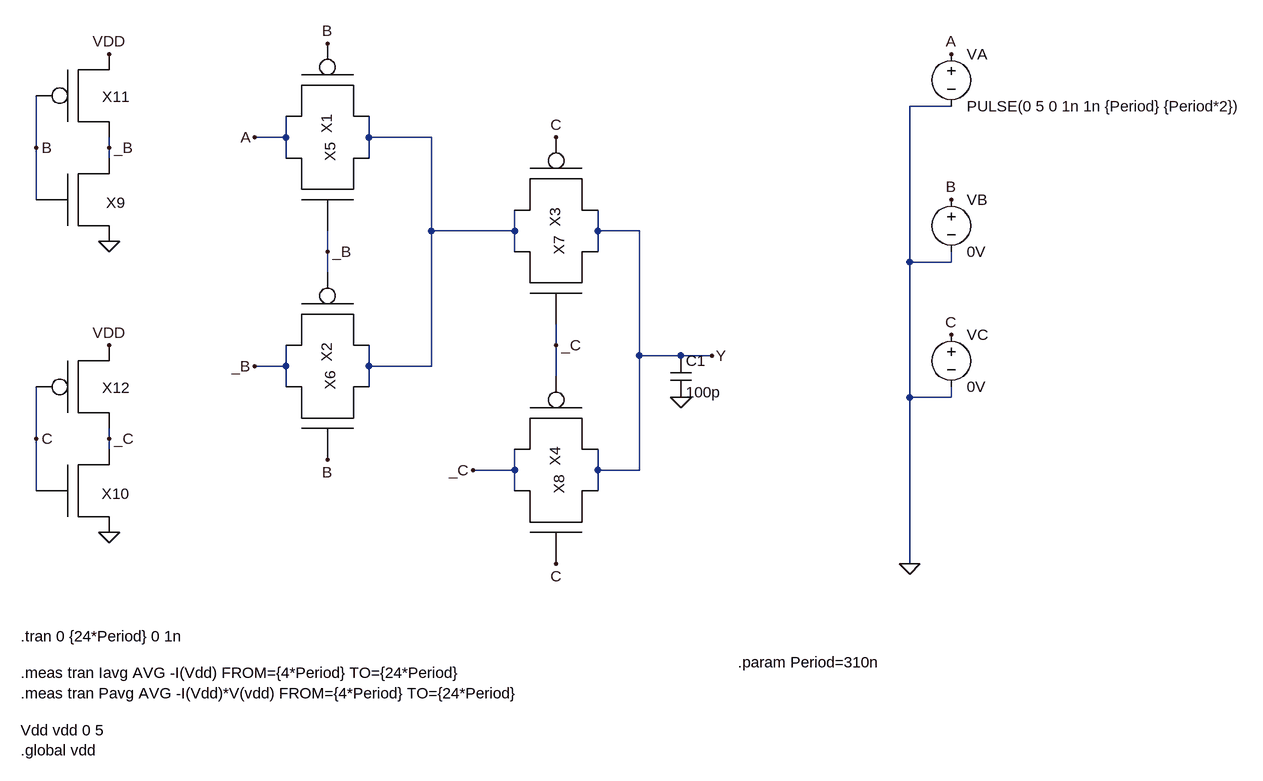
[diagram p0: schematic TLabPonto3_3.asc]
TLabPonto3_3.asc, the LTspice schematic file:
Version 4.1
SHEET 1 1704 848
WIRE 1088 -224 1024 -224
WIRE 64 -176 64 -208
WIRE 64 -176 16 -176
WIRE 192 -176 192 -208
WIRE 288 -176 192 -176
WIRE -320 -160 -320 -240
WIRE -208 -160 -208 -176
WIRE -208 -144 -208 -160
WIRE 64 -144 64 -176
WIRE 192 -144 192 -176
WIRE -320 -80 -320 -160
WIRE 288 -32 288 -176
WIRE 416 -32 416 -64
WIRE 416 -32 288 -32
WIRE 544 -32 544 -64
WIRE 608 -32 544 -32
WIRE 128 0 128 -32
WIRE 416 0 416 -32
WIRE 544 0 544 -32
WIRE 1024 16 1024 -224
WIRE 1088 16 1088 0
WIRE 1088 16 1024 16
WIRE 128 32 128 0
WIRE 480 144 480 112
WIRE 608 160 608 -32
WIRE 672 160 608 160
WIRE 720 160 672 160
WIRE 64 176 64 144
WIRE 64 176 16 176
WIRE 192 176 192 144
WIRE 288 176 288 -32
WIRE 288 176 192 176
WIRE 480 192 480 144
WIRE 64 208 64 176
WIRE 192 208 192 176
WIRE 1024 224 1024 16
WIRE 1088 224 1088 208
WIRE 1088 224 1024 224
WIRE -320 288 -320 208
WIRE -208 288 -208 272
WIRE -208 304 -208 288
WIRE 416 336 416 304
WIRE 416 336 352 336
WIRE 544 336 544 304
WIRE 608 336 608 160
WIRE 608 336 544 336
WIRE -320 368 -320 288
WIRE 416 368 416 336
WIRE 544 368 544 336
WIRE 1024 480 1024 224
FLAG 16 -176 A
FLAG 128 -320 B
FLAG 128 320 B
FLAG 128 0 _B
FLAG 16 176 _B
FLAG 480 -176 C
FLAG 480 480 C
FLAG 480 144 _C
FLAG 352 336 _C
FLAG 720 160 Y
FLAG 1024 480 0
FLAG 1088 -304 A
FLAG 1088 -80 B
FLAG 1088 128 C
FLAG -208 -16 0
FLAG -208 432 0
FLAG -208 -304 VDD
FLAG -208 144 VDD
FLAG -320 -160 B
FLAG -208 -160 _B
FLAG -320 288 C
FLAG -208 288 _C
FLAG 672 224 0
SYMBOL PMOSX 144 -240 R90
SYMATTR InstName X1
SYMBOL PMOSX 144 112 R90
SYMATTR InstName X2
SYMBOL PMOSX 496 -96 R90
SYMATTR InstName X3
SYMBOL PMOSX 496 272 R90
SYMATTR InstName X4
SYMBOL NMOSX 112 -112 R270
SYMATTR InstName X5
SYMBOL NMOSX 112 240 R270
SYMATTR InstName X6
SYMBOL NMOSX 464 32 R270
SYMATTR InstName X7
SYMBOL NMOSX 464 400 R270
SYMATTR InstName X8
SYMBOL voltage 1088 -320 R0
WINDOW 123 24 44 Left 2
WINDOW 39 0 0 Left 0
SYMATTR InstName VA
SYMATTR Value PULSE(0 5 0 1n 1n {Period} {Period*2})
SYMBOL voltage 1088 -96 R0
WINDOW 123 24 44 Left 2
WINDOW 39 0 0 Left 0
SYMATTR InstName VB
SYMATTR Value 0V
SYMBOL voltage 1088 112 R0
WINDOW 123 24 124 Left 2
WINDOW 39 0 0 Left 0
SYMATTR InstName VC
SYMATTR Value 0V
SYMBOL NMOSX -240 -96 R0
SYMATTR InstName X9
SYMBOL NMOSX -240 352 R0
SYMATTR InstName X10
SYMBOL PMOSX -240 -256 R0
SYMATTR InstName X11
SYMBOL PMOSX -240 192 R0
SYMATTR InstName X12
SYMBOL cap 656 160 R0
SYMATTR InstName C1
SYMATTR Value 100p
TEXT -344 592 Left 2 !.tran 0 {24*Period} 0 1n
TEXT -344 648 Left 2 !.meas tran Iavg AVG -I(Vdd) FROM={4*Period} TO={24*Period}\n.meas tran Pavg AVG -I(Vdd)*V(vdd) FROM={4*Period} TO={24*Period}
TEXT -344 736 Left 2 !Vdd vdd 0 5\n.global vdd
TEXT 760 632 Left 2 !.param Period=310n

The netlist it stands for:
* TLabPonto3_3.asc
X§X1 A B N001 PMOSX  ; pins D G S
X§X2 _B _B N001 PMOSX  ; pins D G S
X§X3 N001 C Y PMOSX  ; pins D G S
X§X4 _C _C Y PMOSX  ; pins D G S
X§X5 A _B N001 NMOSX  ; pins D G S
X§X6 _B B N001 NMOSX  ; pins D G S
X§X7 N001 _C Y NMOSX  ; pins D G S
X§X8 _C C Y NMOSX  ; pins D G S
VA A 0 PULSE(0 5 0 1n 1n {Period} {Period*2})
VB B 0 0V
VC C 0 0V
X§X9 _B B 0 NMOSX  ; pins D G S
X§X10 _C C 0 NMOSX  ; pins D G S
X§X11 _B B VDD PMOSX  ; pins D G S
X§X12 _C C VDD PMOSX  ; pins D G S
C1 Y 0 100p
.tran 0 {24*Period} 0 1n
.meas tran Iavg AVG -I(Vdd) FROM={4*Period} TO={24*Period}
.meas tran Pavg AVG -I(Vdd)*V(vdd) FROM={4*Period} TO={24*Period}
Vdd vdd 0 5
.global vdd
.param Period=310n
.lib MOS4007.txt
.backanno
.end